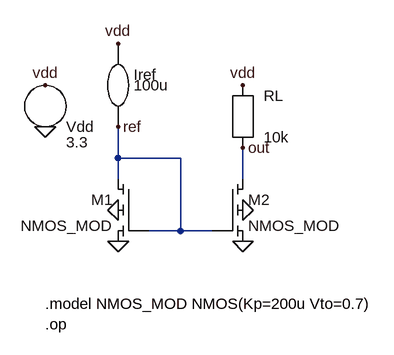
[diagram p0: schematic nmos_mirror_drawn.asc]
nmos_mirror_drawn.asc, the LTspice schematic file:
Version 4
SHEET 1 880 680
WIRE 256 400 352 400
WIRE 208 240 208 320
WIRE 208 288 304 288
WIRE 304 288 304 400
WIRE 400 272 400 320
FLAG 96 176 vdd
FLAG 208 112 vdd
FLAG 400 176 vdd
FLAG 208 240 ref
FLAG 400 272 out
FLAG 96 240 0
FLAG 208 416 0
FLAG 208 368 0
FLAG 400 416 0
FLAG 400 368 0
SYMBOL nmos4 256 320 M0
SYMATTR InstName M1
SYMATTR Value NMOS_MOD
SYMBOL nmos4 352 320 R0
SYMATTR InstName M2
SYMATTR Value NMOS_MOD
SYMBOL current 208 160 R0
SYMATTR InstName Iref
SYMATTR Value 100u
SYMBOL res 400 224 R0
SYMATTR InstName RL
SYMATTR Value 10k
SYMBOL voltage 96 208 R0
SYMATTR InstName Vdd
SYMATTR Value 3.3
TEXT 96 512 Left 2 !.model NMOS_MOD NMOS(Kp=200u Vto=0.7)
TEXT 96 544 Left 2 !.op

The netlist it stands for:
* nmos_mirror_drawn.asc
M1 ref ref 0 0 NMOS_MOD
M2 out ref 0 0 NMOS_MOD
Iref vdd ref 100u
RL vdd out 10k
Vdd vdd 0 3.3
.model NMOS NMOS
.model PMOS PMOS
.lib standard.mos
.model NMOS_MOD NMOS(Kp=200u Vto=0.7)
.op
.backanno
.end